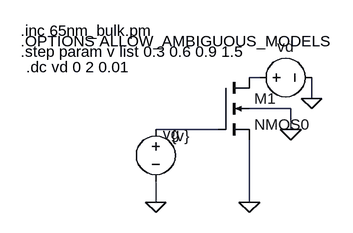
[diagram p0: schematic s3.asc]
s3.asc, the LTspice schematic file:
Version 4.1
SHEET 1 880 680
WIRE 256 176 240 176
WIRE 336 208 336 176
WIRE 304 224 240 224
WIRE 192 256 96 256
WIRE 304 256 304 224
WIRE 96 368 96 336
WIRE 240 368 240 272
FLAG 96 368 0
FLAG 240 368 0
FLAG 336 208 0
FLAG 304 256 0
SYMBOL nmos4 192 176 R0
SYMATTR InstName M1
SYMATTR Value2 l=65nm w=1um
SYMATTR Value NMOS0
SYMBOL voltage 96 240 R0
WINDOW 123 0 0 Left 0
WINDOW 39 0 0 Left 0
WINDOW 3 24 26 Left 2
WINDOW 0 11 23 Left 2
SYMATTR Value {v}
SYMATTR InstName vg
SYMBOL voltage 240 176 R270
WINDOW 0 32 56 VTop 2
WINDOW 3 22 56 VTop 2
WINDOW 123 0 0 Left 0
WINDOW 39 0 0 Left 0
SYMATTR InstName vd
SYMATTR Value ""
TEXT -112 104 Left 2 !.inc 65nm_bulk.pm
TEXT -112 120 Left 2 !.OPTIONS ALLOW_AMBIGUOUS_MODELS
TEXT -104 160 Left 2 !.dc vd 0 2 0.01
TEXT -112 136 Left 2 !.step param v list 0.3 0.6 0.9 1.5

The netlist it stands for:
* s3.asc
M1 N001 N002 0 0 NMOS0 l=65nm w=1um
vg N002 0 {v}
vd N001 0
.model NMOS NMOS
.model PMOS PMOS
.lib standard.mos
.inc 65nm_bulk.pm
.OPTIONS ALLOW_AMBIGUOUS_MODELS
.dc vd 0 2 0.01
.step param v list 0.3 0.6 0.9 1.5
.backanno
.end